# EAGLE schematic powermodule_OLDBUCK (EAGLE 9.6.2)
SCHEMATIC_VERSION: V5.0

## Sheet 1 of 9: SPI-Flash
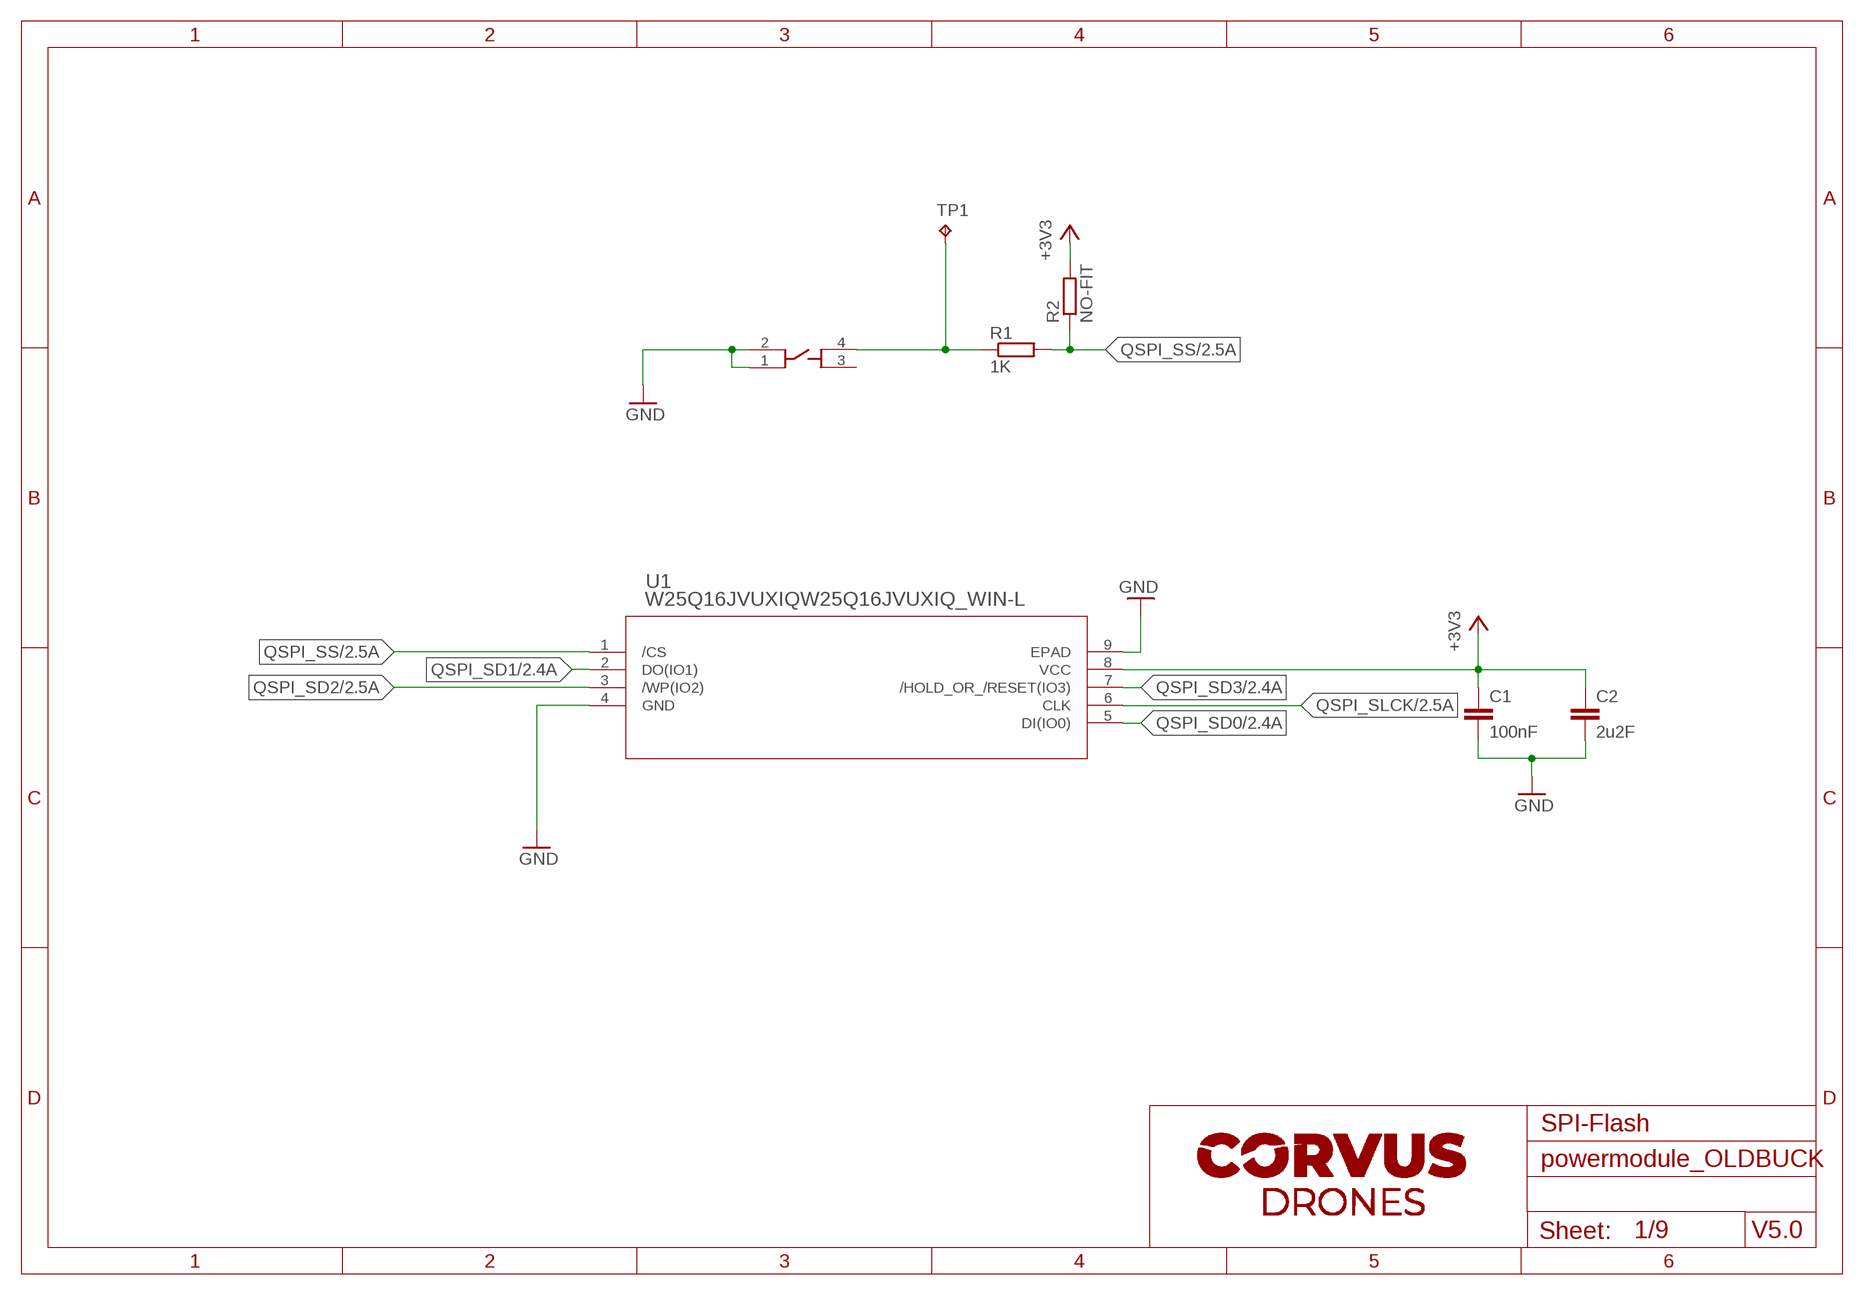
[diagram p0: schematic, sheet 1]

### Parts
C1  100nF  C-EUC0603  [C0603]
C2  2u2F  C-EUC0603  [C0603]
R1  1K  R-EU_R0603  [R0603]
R2  NO-FIT  R-EU_R0603  [R0603]
TP1  TPTP15R  [TP15R]
U1  W25Q16JVUXIQW25Q16JVUXIQ_WIN-L  [W25Q16JVUXIQ_WIN-L]
U$7  BOOTSEL  EVQ-P7J01P  [EVQ-P7J01P]

### Nets
+3V3: C1.1 C2.1 R2.2 U1.8(VCC) ; also sheet 2,4,6,7
GND: C1.2 C2.2 U1.4(GND) U1.9(EPAD) U$7.1 U$7.2 ; also sheet 2,3,4,5,6,7,8,9
N$1: R1.1 TP1.TP U$7.4
QSPI_SD0: U1.5(DI(IO0)) ; also sheet 2
QSPI_SD1: U1.2(DO(IO1)) ; also sheet 2
QSPI_SD2: U1.3(/WP(IO2)) ; also sheet 2
QSPI_SD3: U1.7(/HOLD_OR_/RESET(IO3)) ; also sheet 2
QSPI_SLCK: U1.6(CLK) ; also sheet 2
QSPI_SS: R1.2 R2.1 U1.1(/CS) ; also sheet 2
Unconnected: U$7.3

## Sheet 2 of 9: RP2040 mCU part
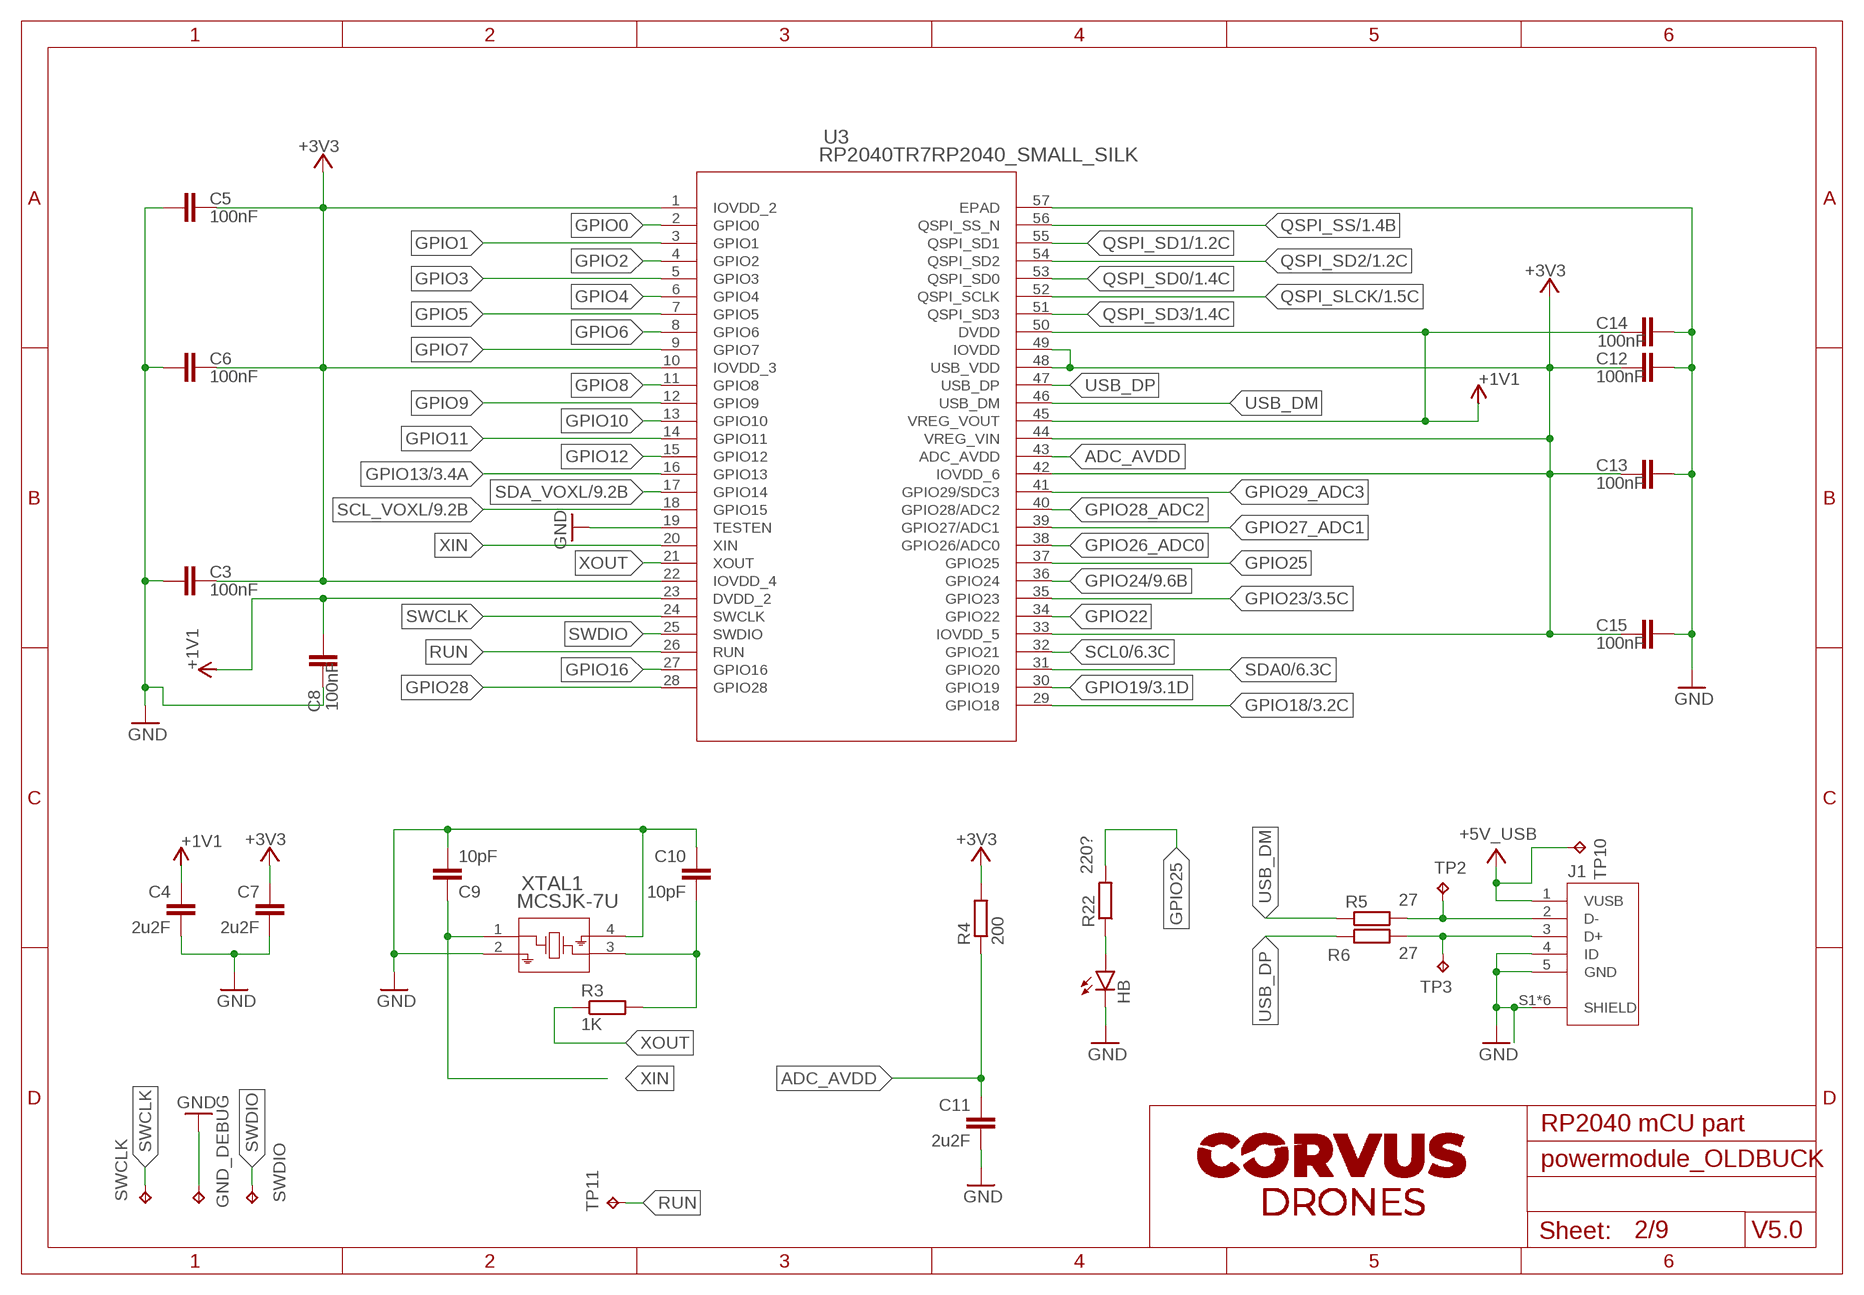
[diagram p1: schematic, sheet 2]

### Parts
C3  100nF  C-EUC0603  [C0603]
C4  2u2F  C-EUC0603  [C0603]
C5  100nF  C-EUC0603  [C0603]
C6  100nF  C-EUC0603  [C0603]
C7  2u2F  C-EUC0603  [C0603]
C8  100nF  C-EUC0603  [C0603]
C9  10pF  C-EUC0603  [C0603]
C10  10pF  C-EUC0603  [C0603]
C11  2u2F  C-EUC0603  [C0603]
C12  100nF  C-EUC0603  [C0603]
C13  100nF  C-EUC0603  [C0603]
C14  100nF  C-EUC0603  [C0603]
C15  100nF  C-EUC0603  [C0603]
GND_DEBUG  TPTP15R  [TP15R]
HB  LEDCHIPLED_0805  [CHIPLED_0805]
J1  10118193-0001LF  [FCI_10118193-0001LF]
R3  1K  R-EU_R0603  [R0603]
R4  200  R-EU_R0603  [R0603]
R5  27  R-EU_R0603  [R0603]
R6  27  R-EU_R0603  [R0603]
R22  220?  R-EU_R0603  [R0603]
SWCLK  TPTP15R  [TP15R]
SWDIO  TPTP15R  [TP15R]
TP2  TPTP15R  [TP15R]
TP3  TPTP15R  [TP15R]
TP10  TPTP15R  [TP15R]
TP11  TPTP15R  [TP15R]
U3  RP2040TR7RP2040_SMALL_SILK  [RP2040TR7_RPI-L_CUSTM]
XTAL1  MCSJK-7U  MCSJK-7U-12.00-10-10-80-B-10SMD3225_3.2X2.5X0.7_MTC-L  [SMD3225_3.2X2.5X0.7_MTC-L]

### Nets
+1V1: C4.2 C8.1 C14.2 U3.23(DVDD_2) U3.45(VREG_VOUT) U3.50(DVDD) ; supply symbol labelled 1V1
+3V3: C3.2 C5.1 C6.1 C7.2 C12.1 C13.1 C15.2 R4.2 U3.1(IOVDD_2) U3.10(IOVDD_3) U3.22(IOVDD_4) U3.33(IOVDD_5) U3.42(IOVDD_6) U3.44(VREG_VIN) U3.48(USB_VDD) U3.49(IOVDD) ; also sheet 1,4,6,7
+5V_USB: J1.1(VUSB) TP10.TP ; also sheet 3
ADC_AVDD: C11.2 R4.1 U3.43(ADC_AVDD)
GND: C3.1 C4.1 C5.2 C6.2 C7.1 C8.2 C9.1 C10.2 C11.1 C12.2 C13.2 C14.1 C15.1 GND_DEBUG.TP HB.C J1.4(ID) J1.5(GND) J1.S1(SHIELD) J1.S2(SHIELD) J1.S3(SHIELD) J1.S4(SHIELD) J1.S5(SHIELD) J1.S6(SHIELD) U3.19(TESTEN) U3.57(EPAD) XTAL1.2 XTAL1.4 ; also sheet 1,3,4,5,6,7,8,9
GPIO0: U3.2(GPIO0)
GPIO1: U3.3(GPIO1)
GPIO2: U3.4(GPIO2)
GPIO3: U3.5(GPIO3)
GPIO4: U3.6(GPIO4)
GPIO5: U3.7(GPIO5)
GPIO6: U3.8(GPIO6)
GPIO7: U3.9(GPIO7)
GPIO8: U3.11(GPIO8)
GPIO9: U3.12(GPIO9)
GPIO10: U3.13(GPIO10)
GPIO11: U3.14(GPIO11)
GPIO12: U3.15(GPIO12)
GPIO13: U3.16(GPIO13) ; also sheet 3
GPIO16: U3.27(GPIO16)
GPIO18: U3.29(GPIO18) ; also sheet 3
GPIO19: U3.30(GPIO19) ; also sheet 3
GPIO22: U3.34(GPIO22)
GPIO23: U3.35(GPIO23) ; also sheet 3
GPIO24: U3.36(GPIO24) ; also sheet 9
GPIO25: R22.2 U3.37(GPIO25)
GPIO26_ADC0: U3.38(GPIO26/ADC0)
GPIO27_ADC1: U3.39(GPIO27/ADC1)
GPIO28: U3.28(GPIO28)
GPIO28_ADC2: U3.40(GPIO28/ADC2)
GPIO29_ADC3: U3.41(GPIO29/SDC3)
N$10: C10.1 R3.2 XTAL1.3
N$24: HB.A R22.1
QSPI_SD0: U3.53(QSPI_SD0) ; also sheet 1
QSPI_SD1: U3.55(QSPI_SD1) ; also sheet 1
QSPI_SD2: U3.54(QSPI_SD2) ; also sheet 1
QSPI_SD3: U3.51(QSPI_SD3) ; also sheet 1
QSPI_SLCK: U3.52(QSPI_SCLK) ; also sheet 1
QSPI_SS: U3.56(QSPI_SS_N) ; also sheet 1
RUN: TP11.TP U3.26(RUN)
SCL0: U3.32(GPIO21) ; also sheet 6
SCL_VOXL: U3.18(GPIO15) ; also sheet 9
SDA0: U3.31(GPIO20) ; also sheet 6
SDA_VOXL: U3.17(GPIO14) ; also sheet 9
SWCLK: SWCLK.TP U3.24(SWCLK)
SWDIO: SWDIO.TP U3.25(SWDIO)
USB_DM: R5.1 U3.46(USB_DM)
USB_DP: R6.1 U3.47(USB_DP)
USBM_DM: J1.2(D-) R5.2 TP2.TP ; also sheet 6
USBM_DP: J1.3(D+) R6.2 TP3.TP ; also sheet 6
XIN: C9.2 U3.20(XIN) XTAL1.1
XOUT: R3.1 U3.21(XOUT)

## Sheet 3 of 9: Buck activators
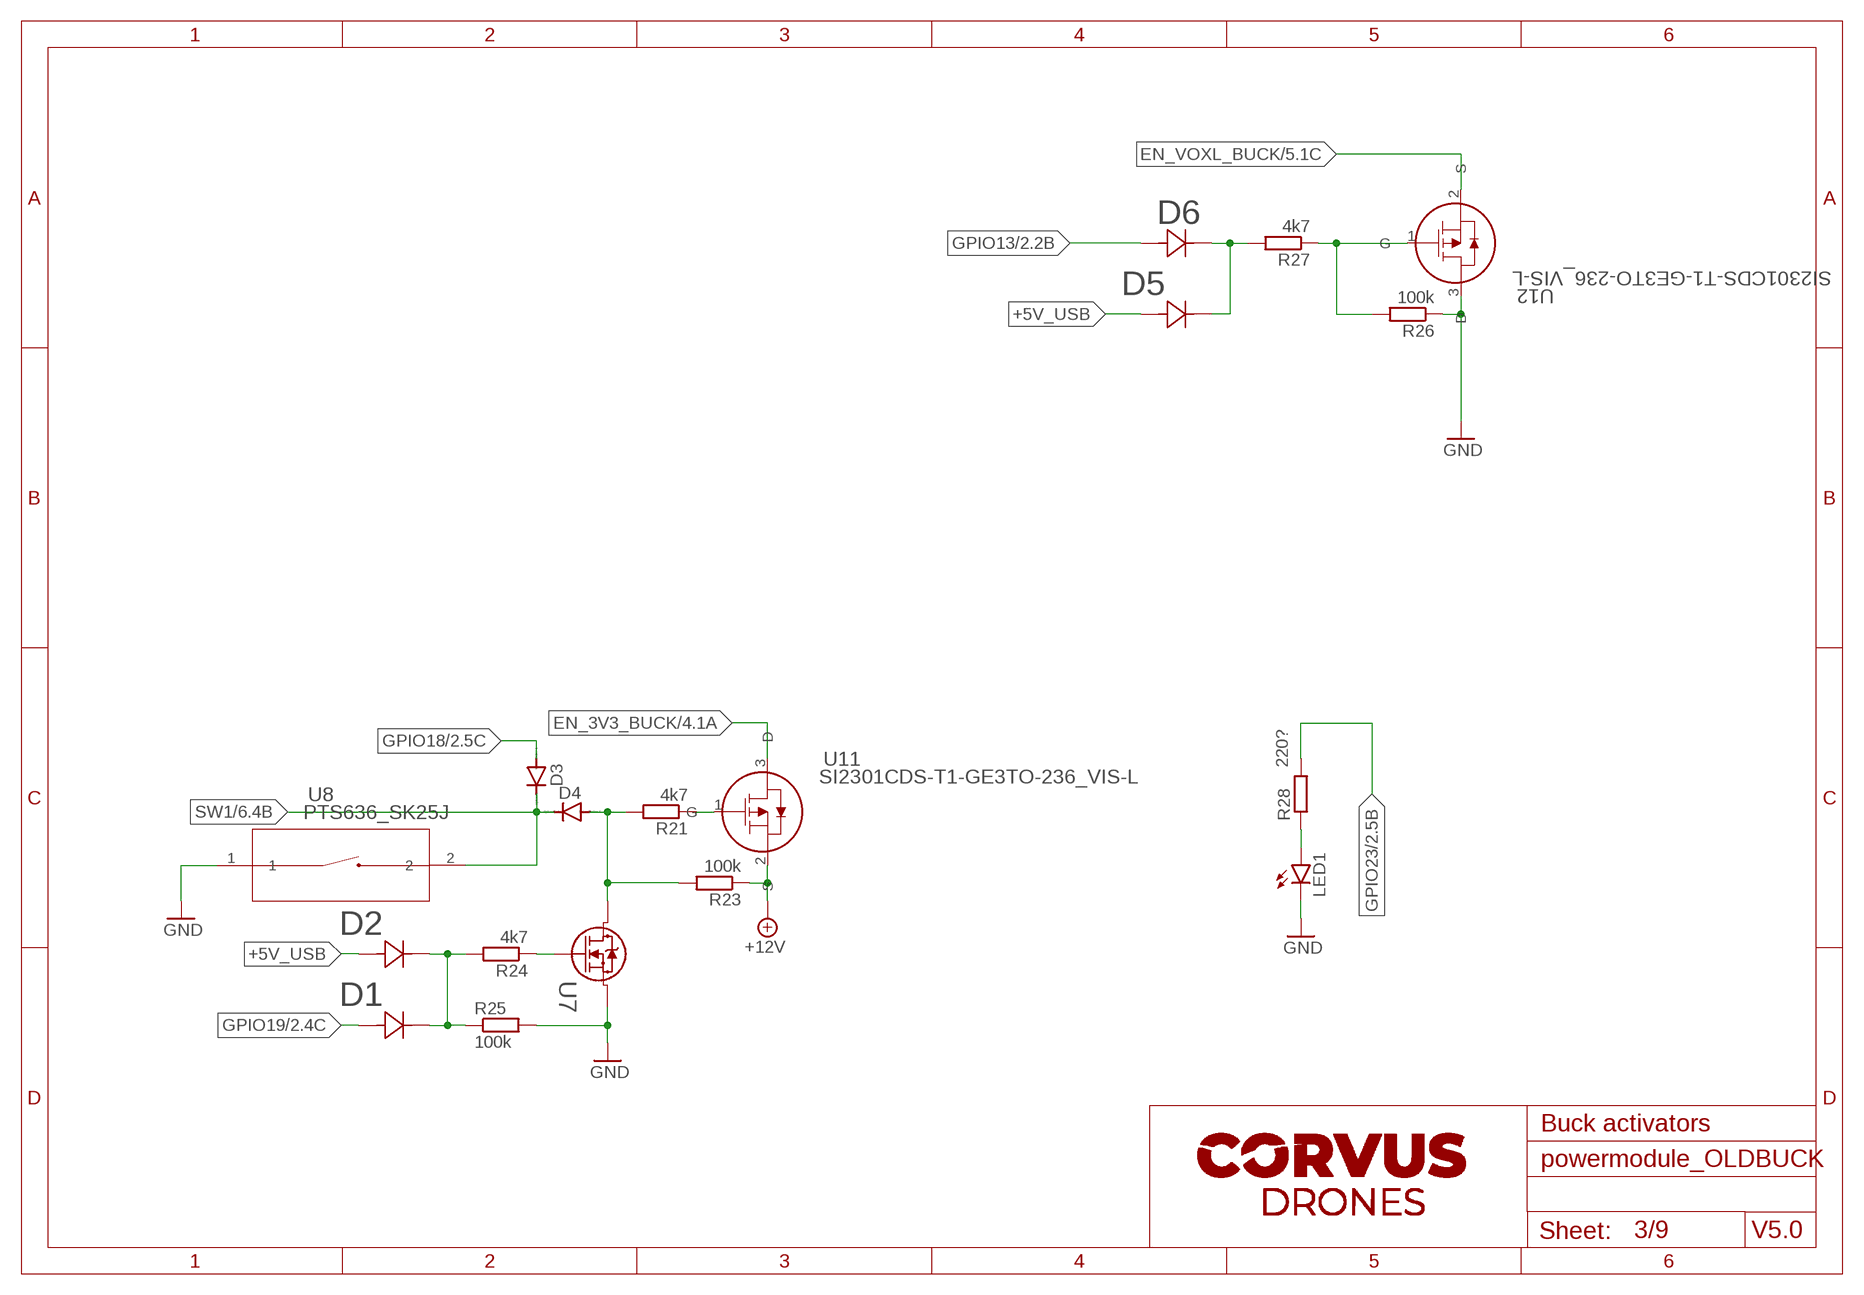
[diagram p2: schematic, sheet 3]

### Parts
D1  1N4148WS-7-FSOD323_DIO-L  [SOD323_DIO-L]
D2  1N4148WS-7-FSOD323_DIO-L  [SOD323_DIO-L]
D3  CGRM4002-G  [SOD-123_MINI-SMA]
D4  CGRM4002-G  [SOD-123_MINI-SMA]
D5  1N4148WS-7-FSOD323_DIO-L  [SOD323_DIO-L]
D6  1N4148WS-7-FSOD323_DIO-L  [SOD323_DIO-L]
LED1  LEDCHIPLED_0805  [CHIPLED_0805]
R21  4k7  R-EU_R0603  [R0603]
R23  100k  R-EU_R0603  [R0603]
R24  4k7  R-EU_R0603  [R0603]
R25  100k  R-EU_R0603  [R0603]
R26  100k  R-EU_R0603  [R0603]
R27  4k7  R-EU_R0603  [R0603]
R28  220?  R-EU_R0603  [R0603]
U7  2N7002,215TO-236AB_NEX-L  [TO-236AB_NEX-L]
U8  PTS636_SK25J  PTS636_SK25J_SMTR_LFSSW_PTS636_SK25J_SMTR_LFS_CNK-M  [SW_PTS636_SK25J_SMTR_LFS_CNK-M]
U11  SI2301CDS-T1-GE3TO-236_VIS-L  [TO-236_VIS-L]
U12  SI2301CDS-T1-GE3TO-236_VIS-L  [TO-236_VIS-L]

### Nets
+5V_USB: D2.2 D5.2 ; also sheet 2
+12V: R23.1 U11.2(S) ; also sheet 4,5,6
EN_3V3_BUCK: U11.3(D) ; also sheet 4
EN_VOXL_BUCK: U12.2(S) ; also sheet 5
GND: LED1.C R25.2 R26.1 U7.2 U8.1 U12.3(D) ; also sheet 1,2,4,5,6,7,8,9
GPIO13: D6.2 ; also sheet 2
GPIO18: D3.A ; also sheet 2
GPIO19: D1.2 ; also sheet 2
GPIO23: R28.2 ; also sheet 2
N$15: R21.1 U11.1(G)
N$21: D5.1 D6.1 R27.2
N$25: D4.A R21.2 R23.2 U7.3
N$26: R26.2 R27.1 U12.1(G)
N$27: R24.1 U7.1
N$28: LED1.A R28.1
N$30: D1.1 D2.1 R24.2 R25.1
SW1: D3.C D4.C U8.2 ; also sheet 6

## Sheet 4 of 9: 3V3 & 5V buck
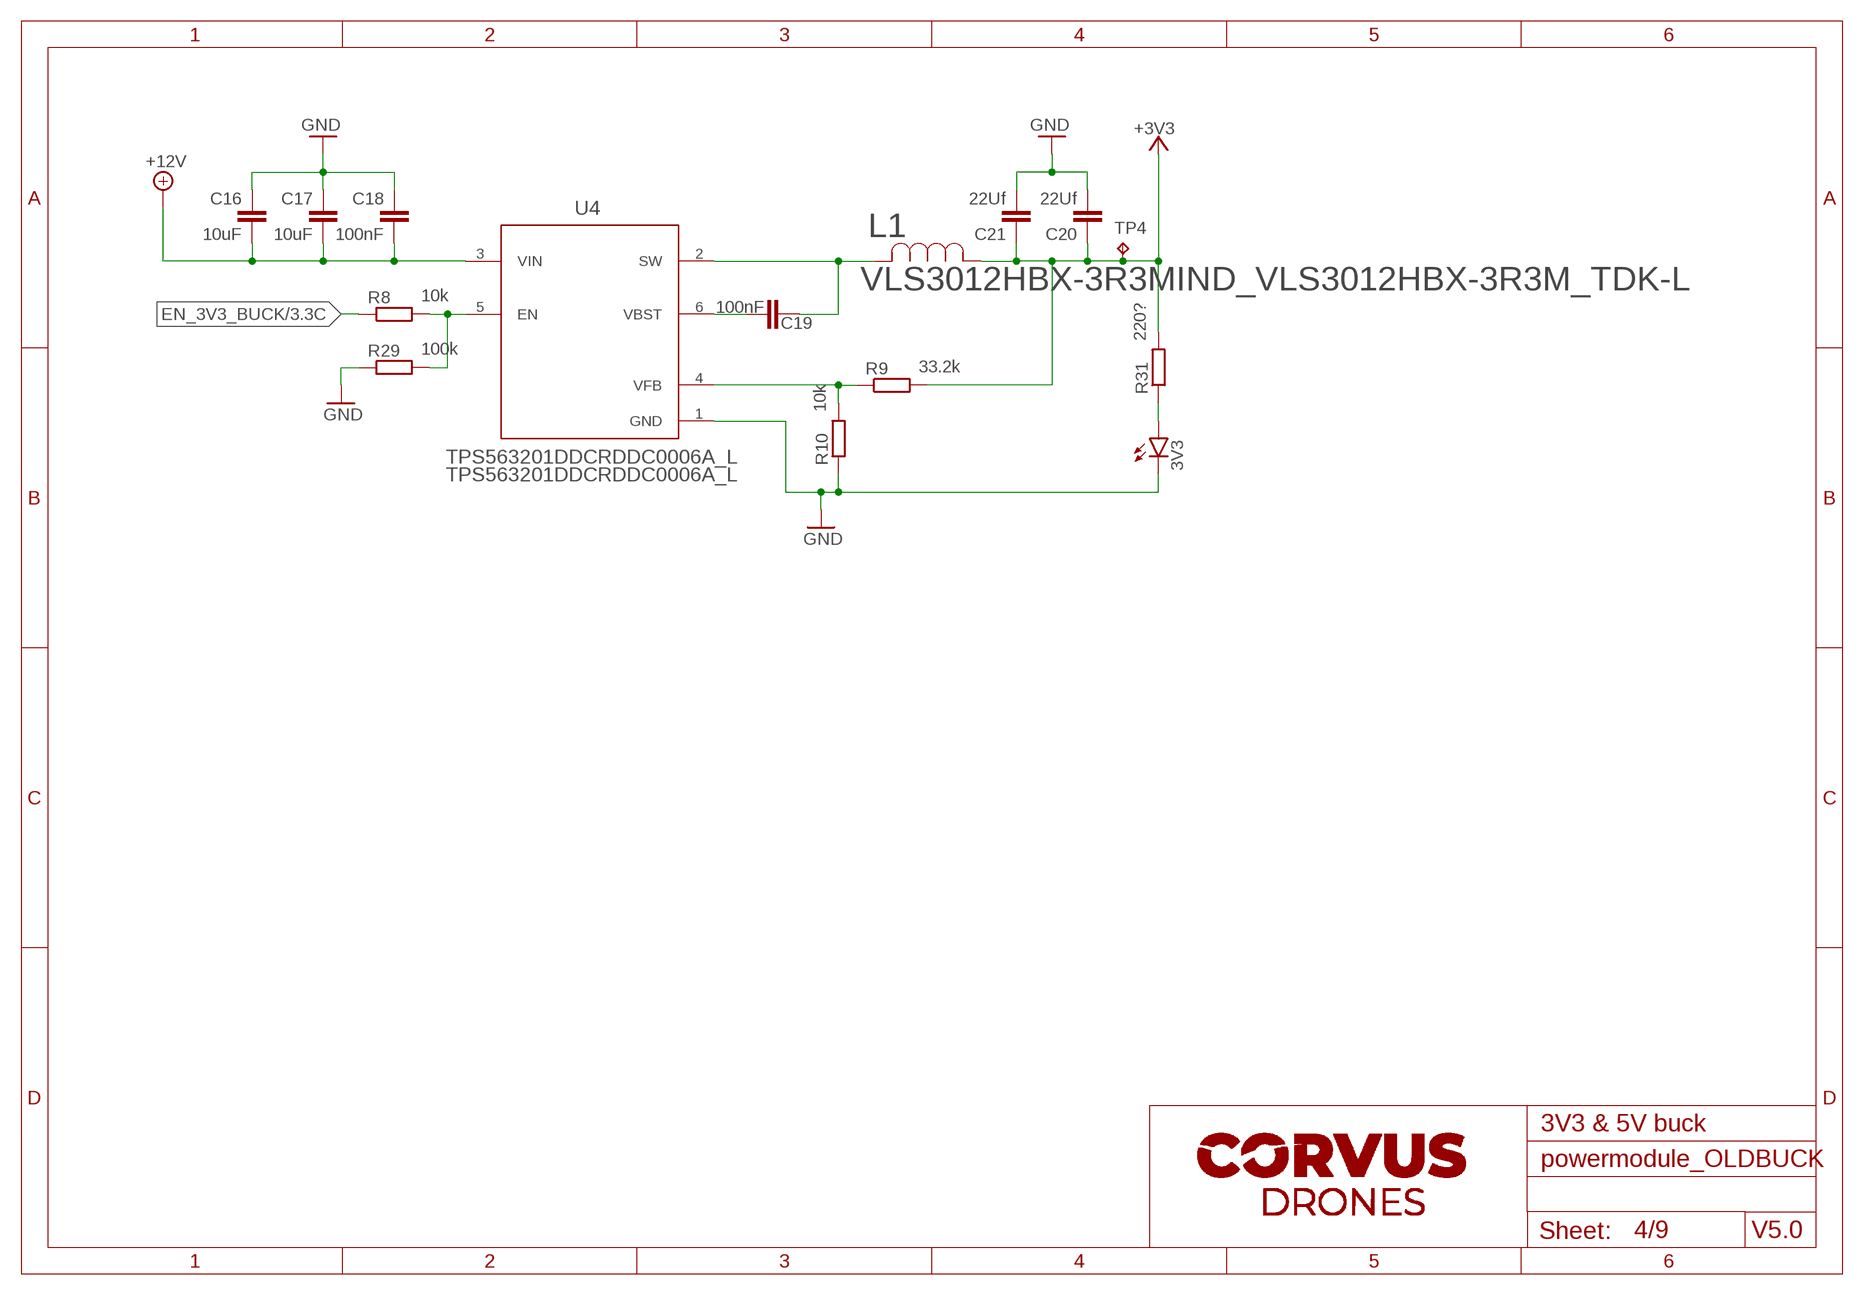
[diagram p3: schematic, sheet 4]

### Parts
3V3  LEDCHIPLED_0805  [CHIPLED_0805]
C16  10uF  C-EUC0603  [C0603]
C17  10uF  C-EUC0603  [C0603]
C18  100nF  C-EUC0603  [C0603]
C19  100nF  C-EUC0603  [C0603]
C20  22Uf  C-EUC1206  [C1206]
C21  22Uf  C-EUC1206  [C1206]
L1  VLS3012HBX-3R3MIND_VLS3012HBX-3R3M_TDK-L  [IND_VLS3012HBX-3R3M_TDK-L]
R8  10k  R-EU_R0603  [R0603]
R9  33.2k  R-EU_R0603  [R0603]
R10  10k  R-EU_R0603  [R0603]
R29  100k  R-EU_R0603  [R0603]
R31  220?  R-EU_R0603  [R0603]
TP4  TPTP15R  [TP15R]
U4  TPS563201DDCRDDC0006A_L  [DDC0006A_L]

### Nets
+3V3: C20.1 C21.1 L1.1 R9.2 R31.2 TP4.TP ; also sheet 1,2,6,7
+12V: C16.1 C17.1 C18.1 U4.3(VIN) ; also sheet 3,5,6
EN_3V3_BUCK: R8.1 ; also sheet 3
GND: 3V3.C C16.2 C17.2 C18.2 C20.2 C21.2 R10.1 R29.1 U4.1(GND) ; also sheet 1,2,3,5,6,7,8,9
N$4: R8.2 R29.2 U4.5(EN)
N$5: R9.1 R10.2 U4.4(VFB)
N$6: C19.1 U4.6(VBST)
N$8: C19.2 L1.2 U4.2(SW)
N$32: 3V3.A R31.1

## Sheet 5 of 9: Buckconveter voxl
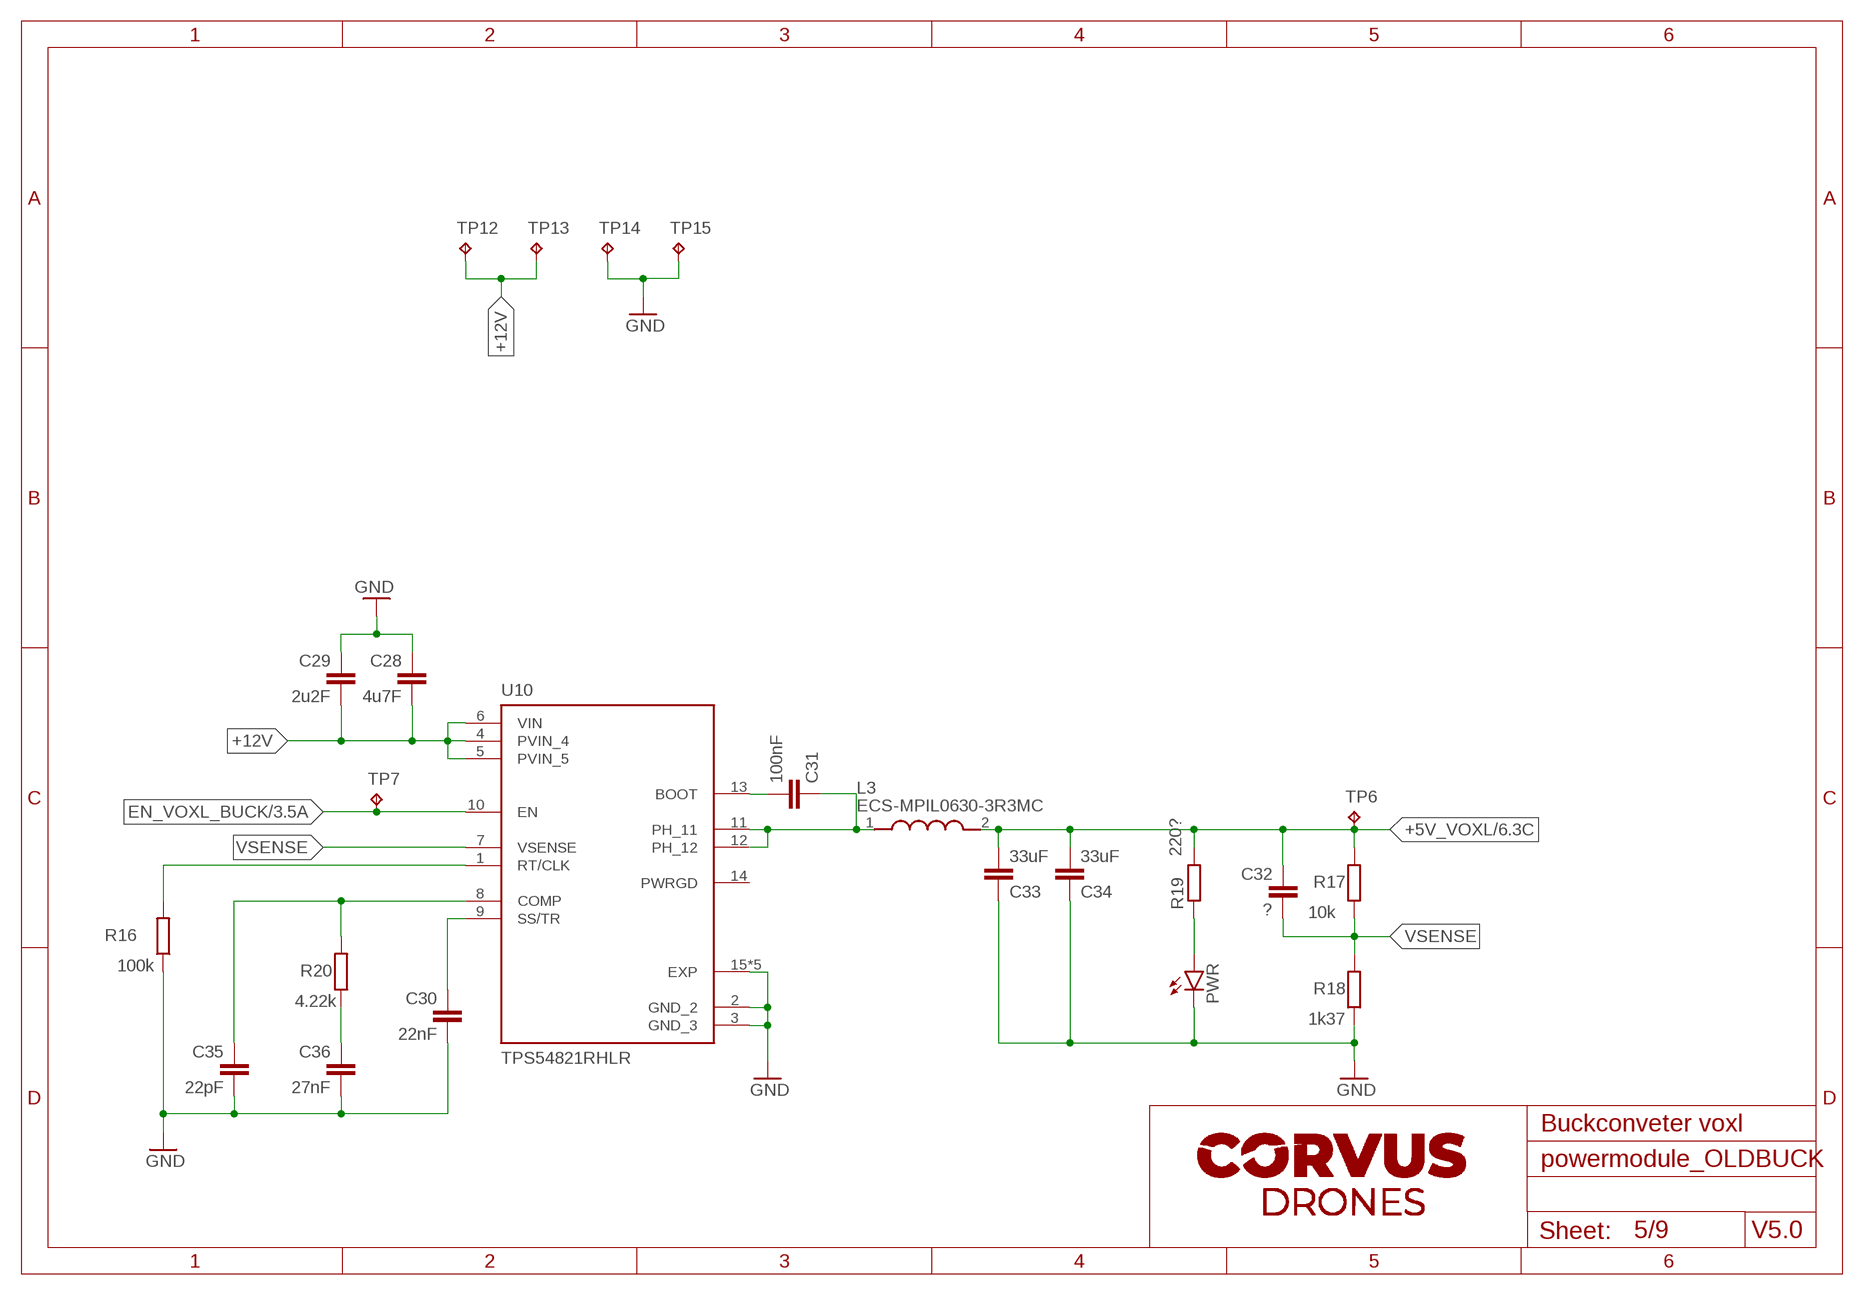
[diagram p4: schematic, sheet 5]

### Parts
C28  4u7F  C_08054U7  [C0805]
C29  2u2F  C_08052U2  [C0805]
C30  22nF  C-EUC0603  [C0603]
C31  100nF  C-EUC0603  [C0603]
C32  ?  C-EUC0603  [C0603]
C33  33uF  C-EUC1206  [C1206]
C34  33uF  C-EUC1206  [C1206]
C35  22pF  C-EUC0603  [C0603]
C36  27nF  C-EUC0603  [C0603]
L3  ECS-MPIL0630-3R3MC  [IND_ECS-MPIL0630-3R3MC]
PWR  LEDCHIPLED_0805  [CHIPLED_0805]
R16  100k  R-EU_R0603  [R0603]
R17  10k  R-EU_R0603  [R0603]
R18  1k37  R-EU_R0603  [R0603]
R19  220?  R-EU_R0603  [R0603]
R20  4.22k  R-EU_R0603  [R0603]
TP6  TPTP15R  [TP15R]
TP7  TPTP15R  [TP15R]
TP12  TPTP15R  [TP15R]
TP13  TPTP15R  [TP15R]
TP14  TPTP15R  [TP15R]
TP15  TPTP15R  [TP15R]
U10  TPS54821RHLR  [IC_TPS54821RHLR]

### Nets
+5V_VOXL: C32.2 C33.1 C34.1 L3.2 R17.2 R19.2 TP6.TP ; also sheet 6,7,8
+12V: C28.1 C29.1 TP12.TP TP13.TP U10.4(PVIN_4) U10.5(PVIN_5) U10.6(VIN) ; also sheet 3,4,6
EN_VOXL_BUCK: TP7.TP U10.10(EN) ; also sheet 3
GND: C28.2 C29.2 C30.1 C33.2 C34.2 C35.1 C36.1 PWR.C R16.1 R18.1 TP14.TP TP15.TP U10.2(GND_2) U10.3(GND_3) U10.15(EXP) U10.16(EXP) U10.17(EXP) U10.18(EXP) U10.19(EXP) ; also sheet 1,2,3,4,6,7,8,9
N$16: R16.2 U10.1(RT/CLK)
N$17: C31.2 L3.1 U10.11(PH_11) U10.12(PH_12)
N$18: C30.2 U10.9(SS/TR)
N$19: C31.1 U10.13(BOOT)
N$20: PWR.A R19.1
N$22: C35.2 R20.2 U10.8(COMP)
N$23: C36.2 R20.1
VSENSE: C32.1 R17.1 R18.2 U10.7(VSENSE)
Unconnected: U10.14(PWRGD)

## Sheet 6 of 9: connections
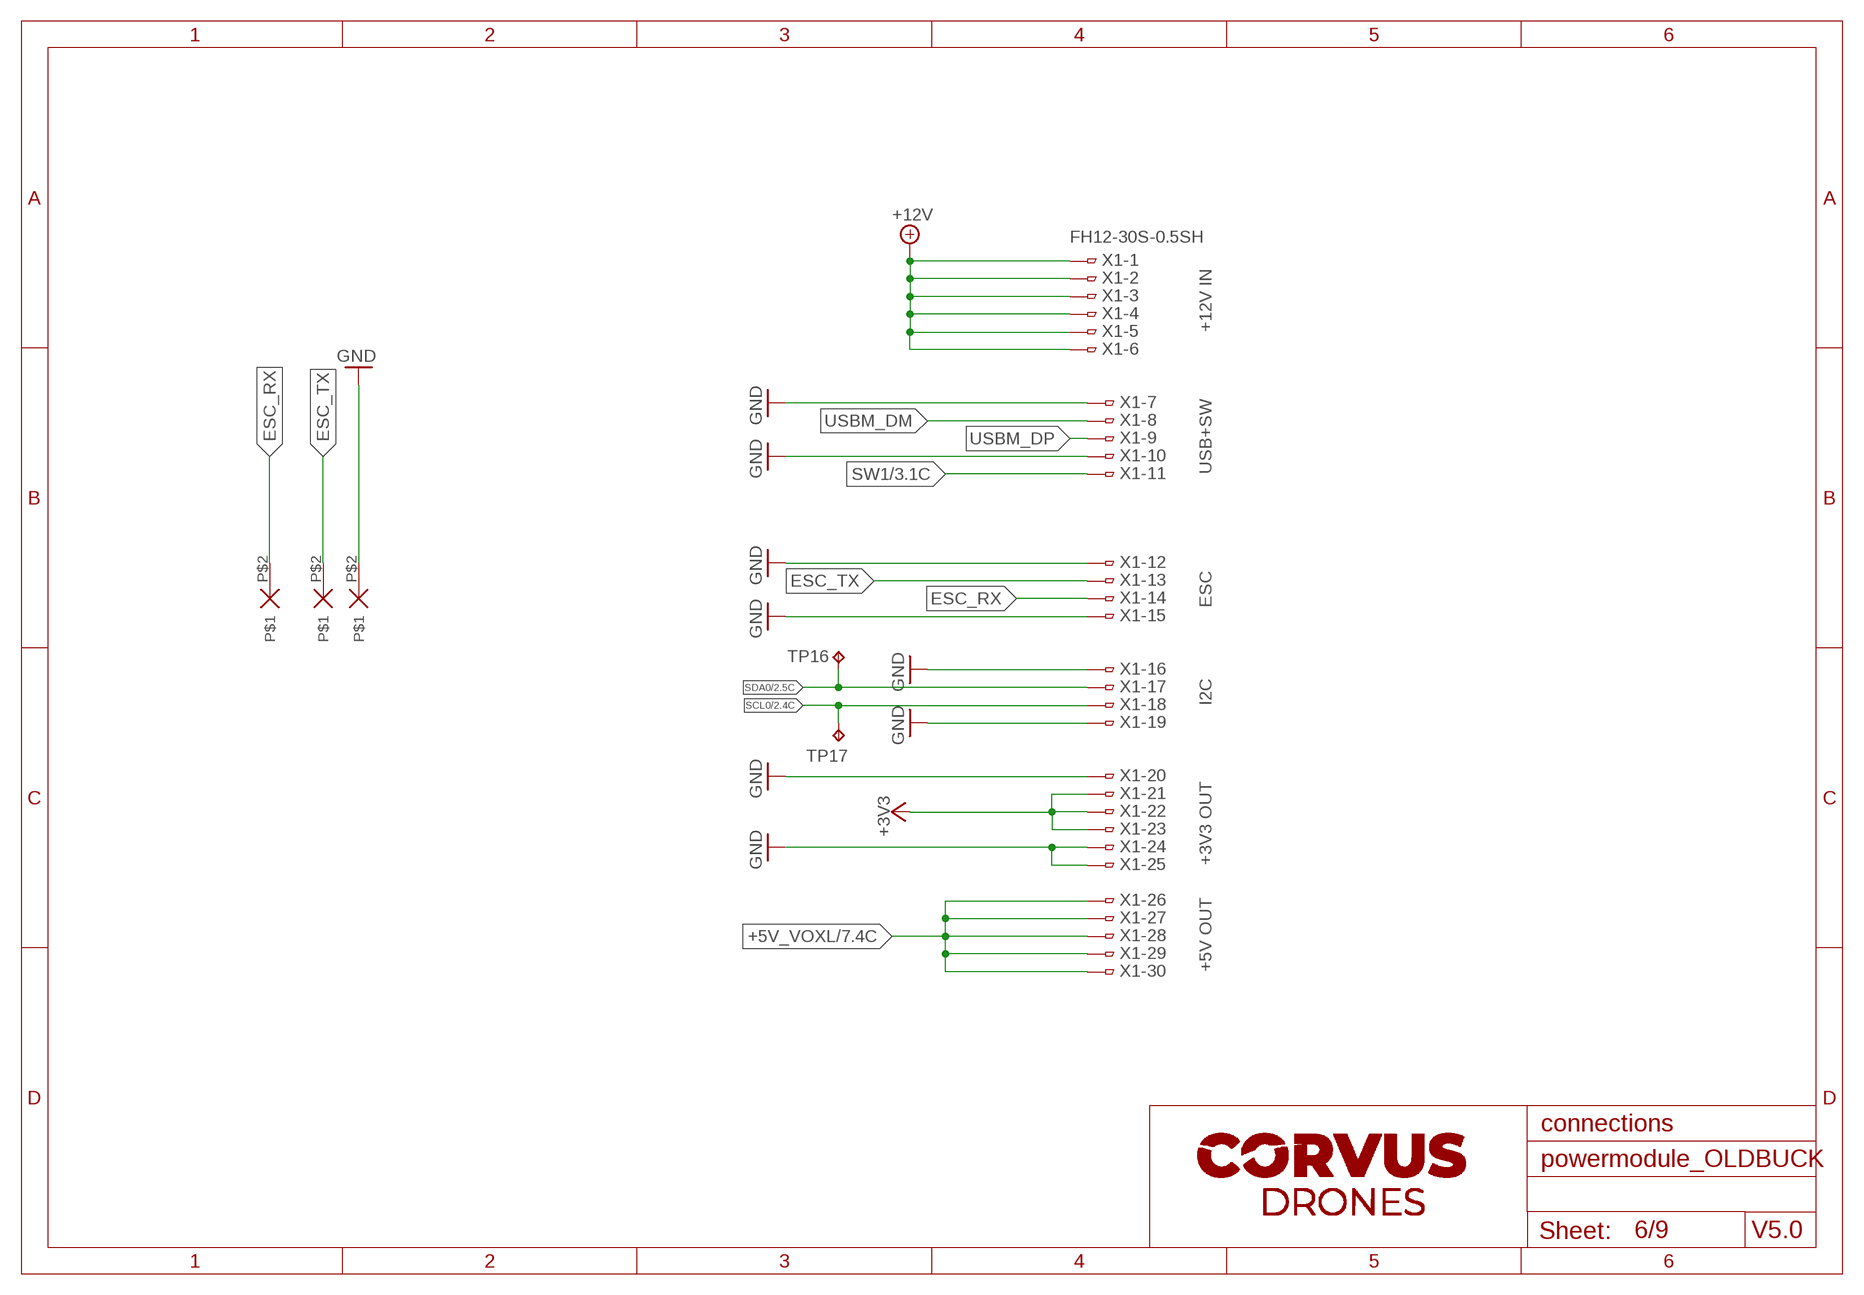
[diagram p5: schematic, sheet 6]

### Parts
EGND  TH-0.75/0.6  [TH-0.75/0.6]
RX  TH-0.75/0.6  [TH-0.75/0.6]
TP16  TPTP15R  [TP15R]
TP17  TPTP15R  [TP15R]
TX  TH-0.75/0.6  [TH-0.75/0.6]
X1  FH12-30S-0.5SH  [FH12-30S-0.5SH]

### Nets
+3V3: X1.21 X1.22 X1.23 ; also sheet 1,2,4,7
+5V_VOXL: X1.26 X1.27 X1.28 X1.29 X1.30 ; also sheet 5,7,8
+12V: X1.1 X1.2 X1.3 X1.4 X1.5 X1.6 ; also sheet 3,4,5
ESC_RX: RX.P$2 X1.14
ESC_TX: TX.P$2 X1.13
GND: EGND.P$2 X1.7 X1.10 X1.12 X1.15 X1.16 X1.19 X1.20 X1.24 X1.25 ; also sheet 1,2,3,4,5,7,8,9
SCL0: TP17.TP X1.18 ; also sheet 2
SDA0: TP16.TP X1.17 ; also sheet 2
SW1: X1.11 ; also sheet 3
USBM_DM: X1.8 ; also sheet 2
USBM_DP: X1.9 ; also sheet 2

### Notes on the sheet
- +12V IN
- USB+SW
- ESC
- I2C
- +3V3 OUT
- +5V OUT

## Sheet 7 of 9: WiFi
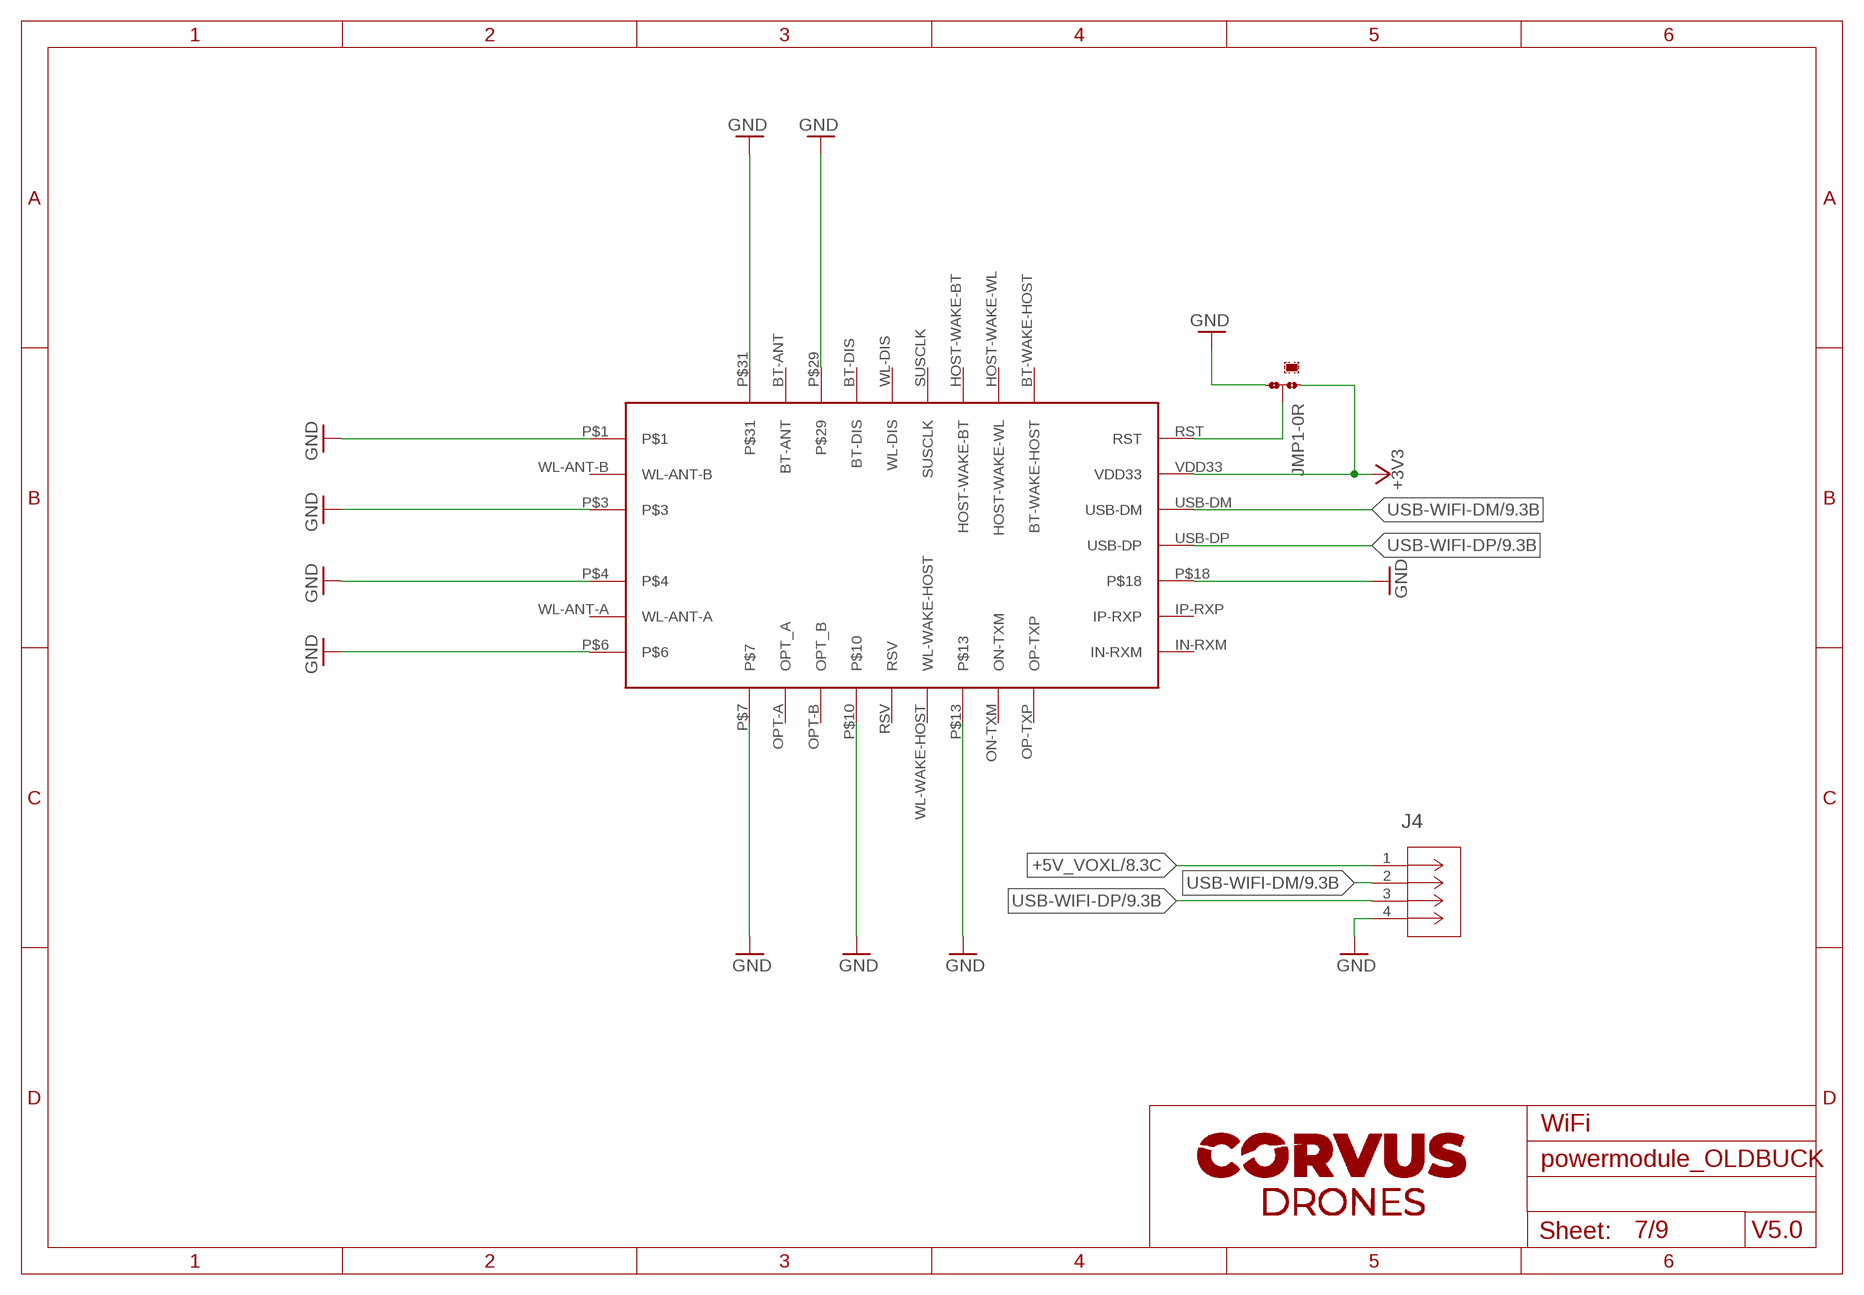
[diagram p6: schematic, sheet 7]

### Parts
J4  USB1125-GF-B  [CONN_USB1125-GF-B_GCT]
JMP1  0R-JUMPA  [A0R-JMP]
U$5  WIFI-RTL8822BU  [WIFI-RTL8822BU]

### Nets
+3V3: JMP1.1 U$5.VDD33 ; also sheet 1,2,4,6
+5V_VOXL: J4.1 ; also sheet 5,6,8
GND: J4.4 JMP1.3 U$5.P$1 U$5.P$3 U$5.P$4 U$5.P$6 U$5.P$7 U$5.P$10 U$5.P$13 U$5.P$18 U$5.P$29 U$5.P$31 ; also sheet 1,2,3,4,5,6,8,9
N$13: JMP1.2 U$5.RST
USB-WIFI-DM: J4.2 U$5.USB-DM ; also sheet 9
USB-WIFI-DP: J4.3 U$5.USB-DP ; also sheet 9
Unconnected: U$5.BT-ANT U$5.BT-DIS U$5.BT-WAKE-HOST U$5.HOST-WAKE-BT U$5.HOST-WAKE-WL U$5.IN-RXM U$5.IP-RXP U$5.ON-TXM U$5.OP-TXP U$5.OPT-A(OPT_A) U$5.OPT-B(OPT_B) U$5.RSV U$5.SUSCLK U$5.WL-ANT-A U$5.WL-ANT-B U$5.WL-DIS U$5.WL-WAKE-HOST

## Sheet 8 of 9: Voxl2 connection [J5]
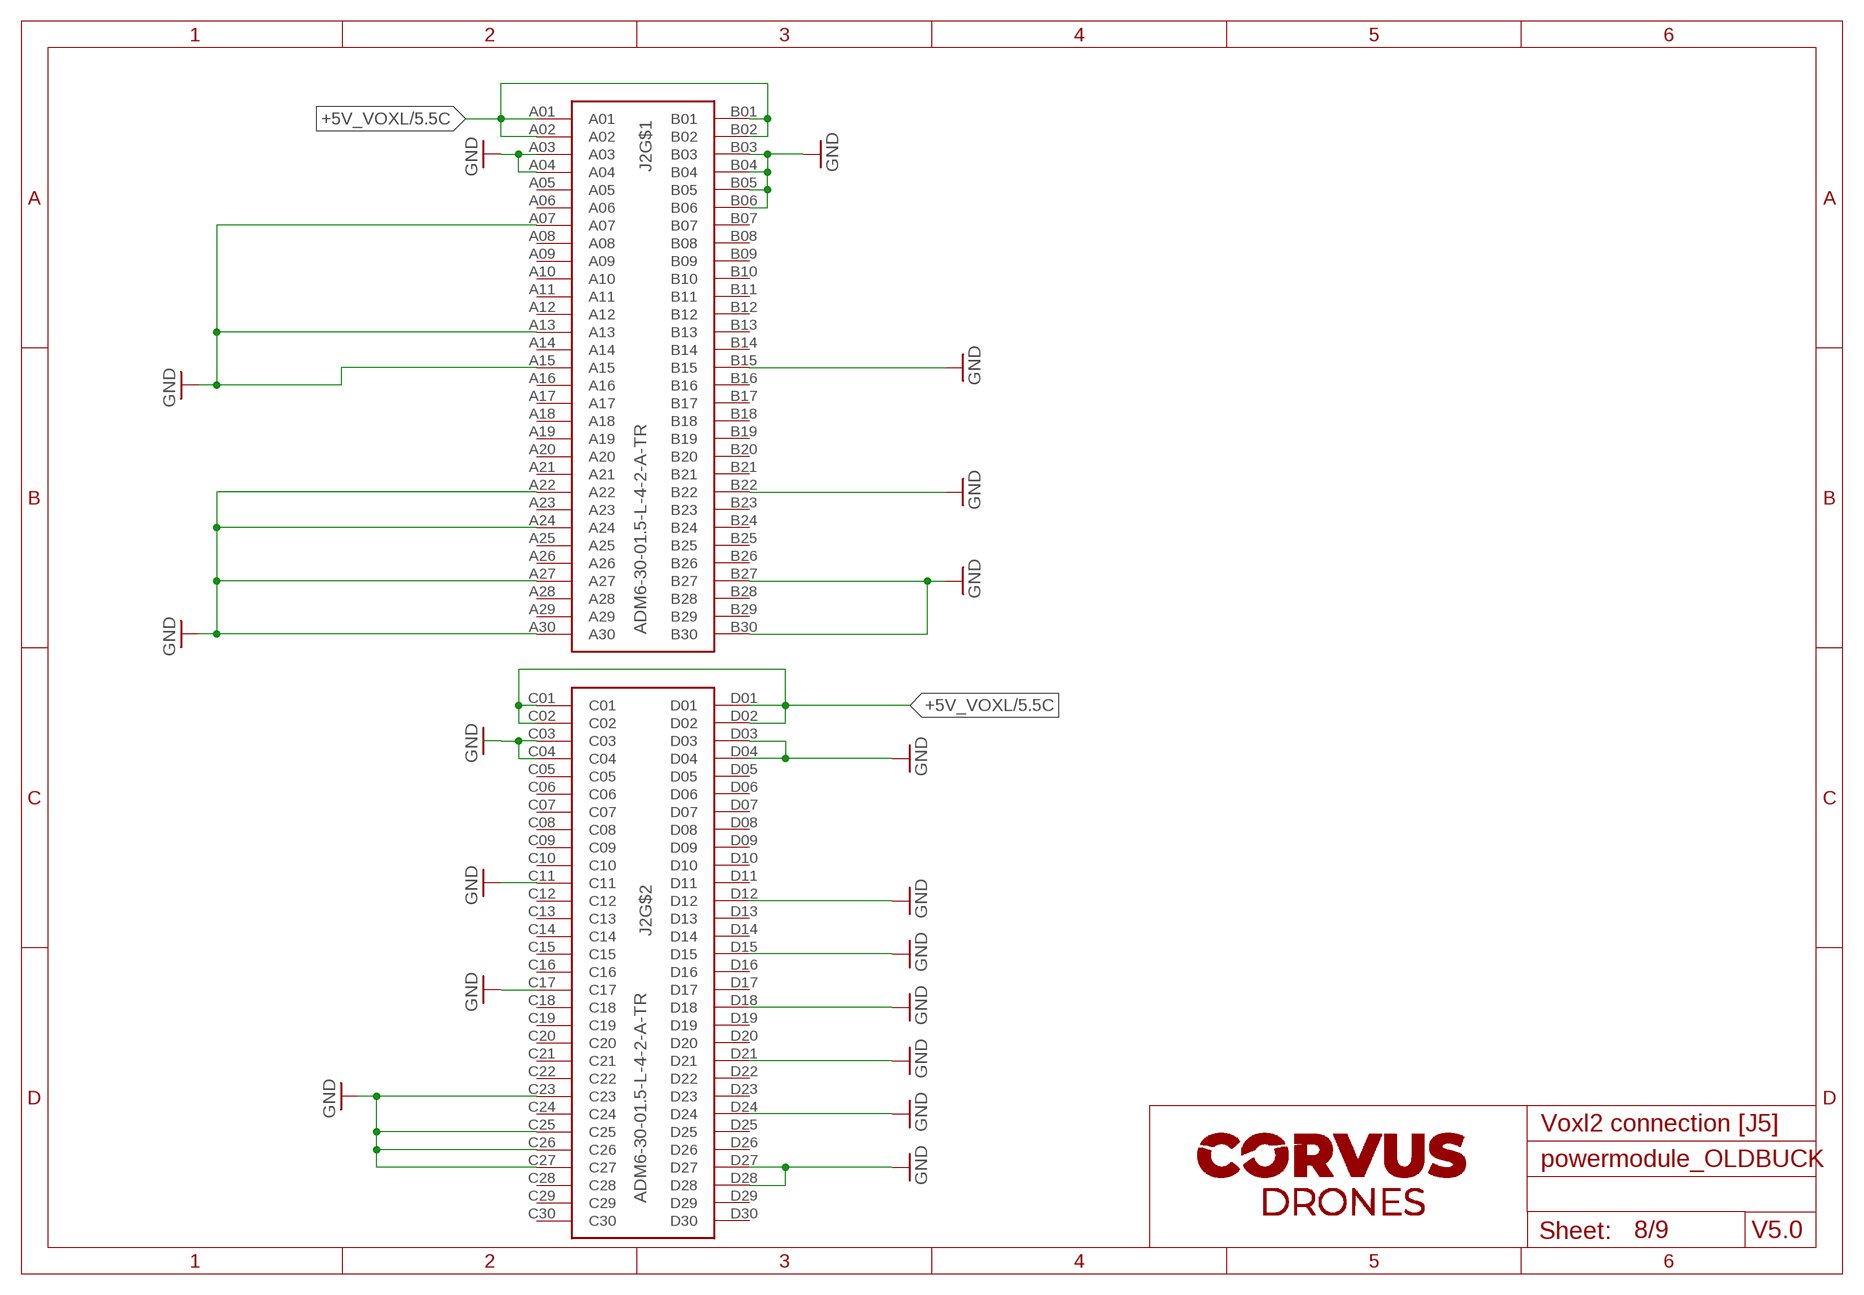
[diagram p7: schematic, sheet 8]

### Parts
J2  ADM6-30-01.5-L-4-2-A-TR  [SAMTEC_ADM6-30-01.5-L-4-2-A-TR]

### Nets
+5V_VOXL: J2.A01 J2.A02 J2.B01 J2.B02 J2.C01 J2.C02 J2.D01 J2.D02 ; also sheet 5,6,7
GND: J2.A03 J2.A04 J2.A07 J2.A13 J2.A15 J2.A22 J2.A24 J2.A27 J2.A30 J2.B03 J2.B04 J2.B05 J2.B06 J2.B15 J2.B22 J2.B27 J2.B30 J2.C03 J2.C04 J2.C11 J2.C17 J2.C23 J2.C25 J2.C26 J2.C27 J2.D03 J2.D04 J2.D12 J2.D15 J2.D18 J2.D21 J2.D24 J2.D27 J2.D28 ; also sheet 1,2,3,4,5,6,7,9
Unconnected: J2.A05 J2.A06 J2.A08 J2.A09 J2.A10 J2.A11 J2.A12 J2.A14 J2.A16 J2.A17 J2.A18 J2.A19 J2.A20 J2.A21 J2.A23 J2.A25 J2.A26 J2.A28 J2.A29 J2.B07 J2.B08 J2.B09 J2.B10 J2.B11 J2.B12 J2.B13 J2.B14 J2.B16 J2.B17 J2.B18 J2.B19 J2.B20 J2.B21 J2.B23 J2.B24 J2.B25 J2.B26 J2.B28 J2.B29 J2.C05 J2.C06 J2.C07 J2.C08 J2.C09 J2.C10 J2.C12 J2.C13 J2.C14 J2.C15 J2.C16 J2.C18 J2.C19 J2.C20 J2.C21 J2.C22 J2.C24 J2.C28 J2.C29 J2.C30 J2.D05 J2.D06 J2.D07 J2.D08 J2.D09 J2.D10 J2.D11 J2.D13 J2.D14 J2.D16 J2.D17 J2.D19 J2.D20 J2.D22 J2.D23 J2.D25 J2.D26 J2.D29 J2.D30

## Sheet 9 of 9: VOXL2 Connection [J3]
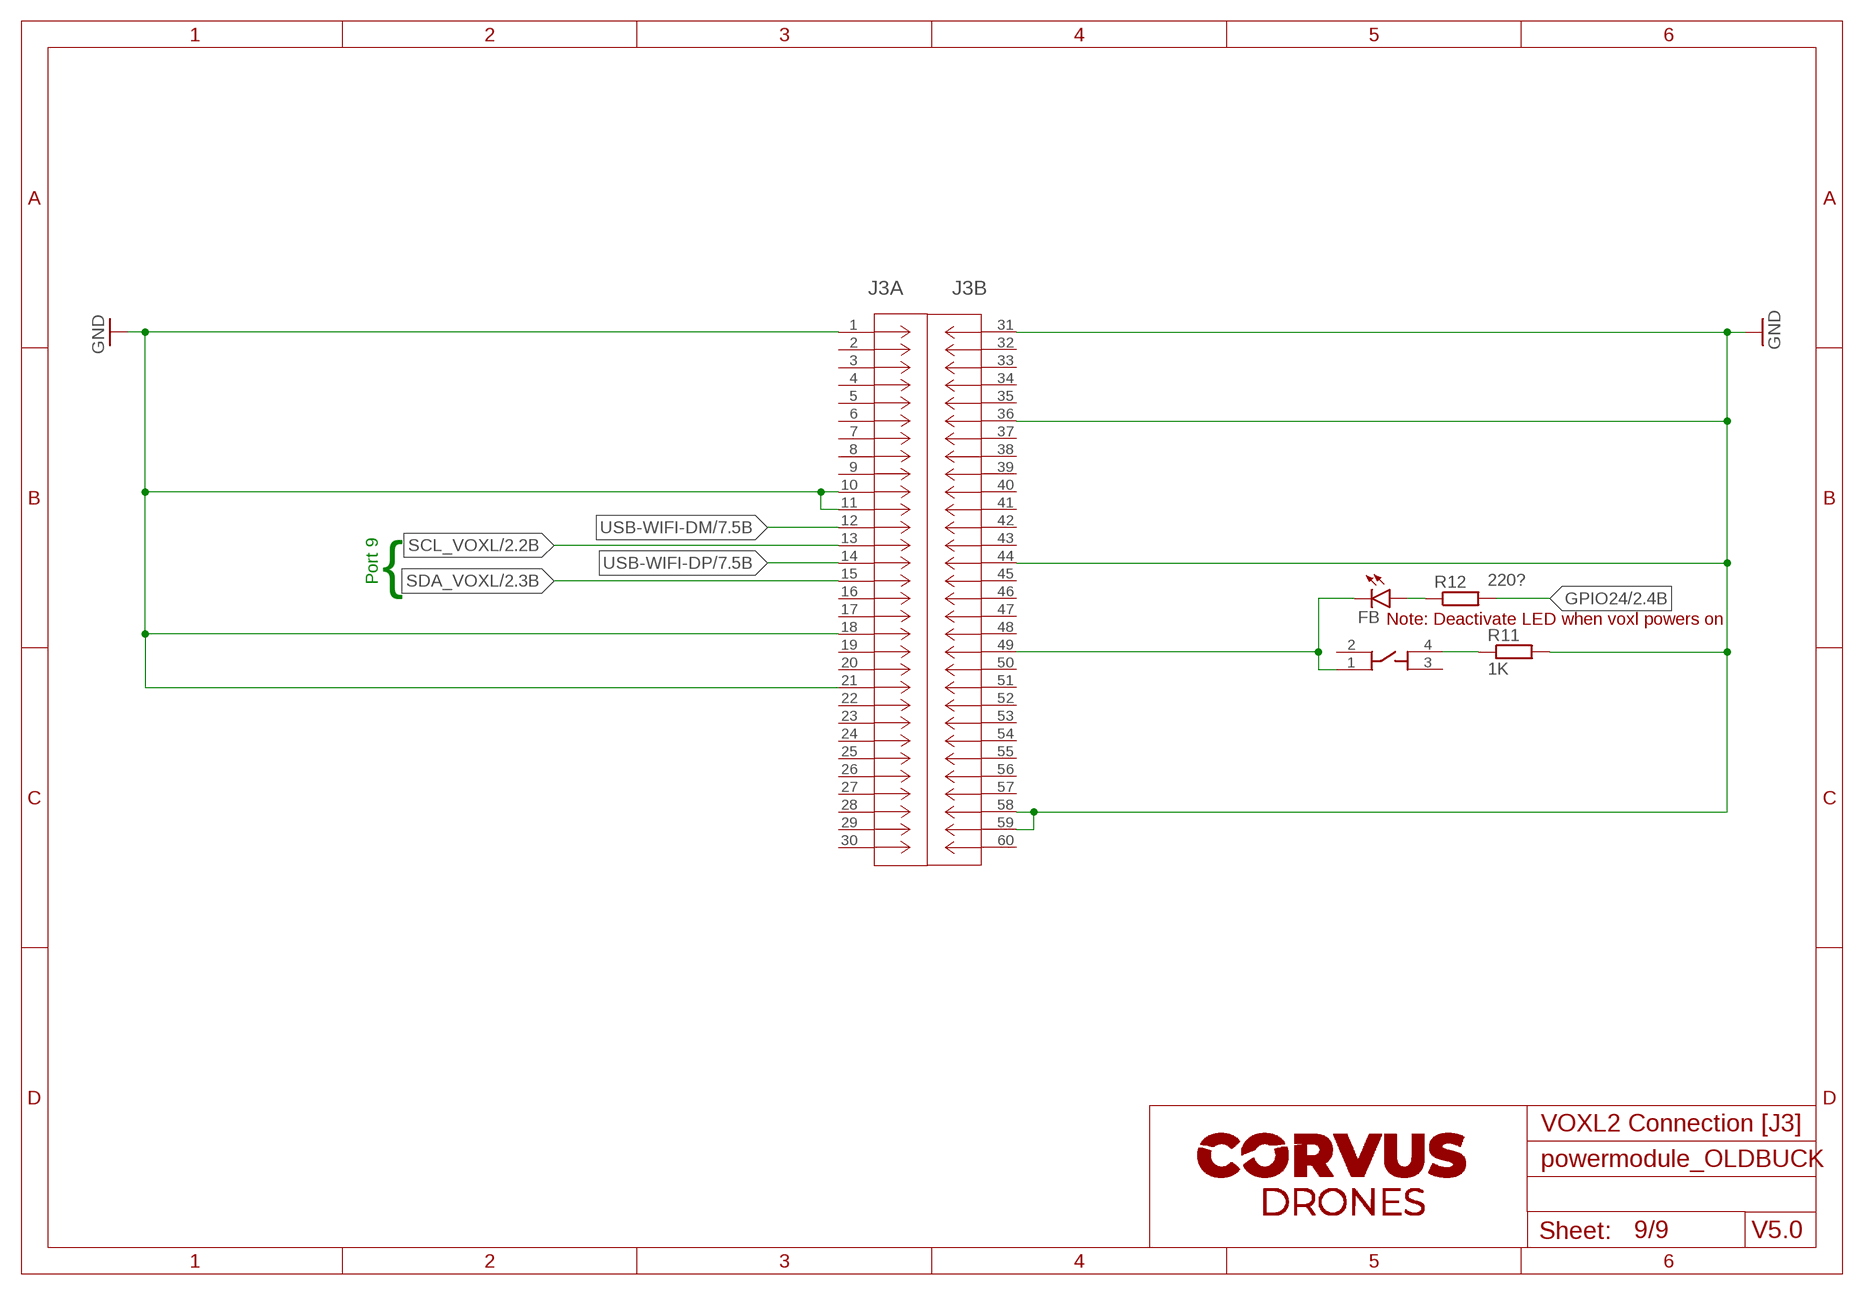
[diagram p8: schematic, sheet 9]

### Parts
FB  LEDCHIPLED_0805  [CHIPLED_0805]
J3  QTH-030-01-L-D-ACONN_QTH-030-02-L-D-A-K-FR_S00  [CONN_QTH-030-02-L-D-A-K-FR_S00]
R11  1K  R_0603_1K  [R0603]
R12  220?  R-EU_R0603  [R0603]
U$6  FASTBOOT  EVQ-P7J01P  [EVQ-P7J01P]

### Nets
GND: J3.1 J3.10 J3.11 J3.18 J3.21 J3.31 J3.36 J3.44 J3.58 J3.59 R11.2 ; also sheet 1,2,3,4,5,6,7,8
GPIO24: R12.2 ; also sheet 2
N$7: R11.1 U$6.4
N$9: FB.C J3.49 U$6.1
N$12: FB.A R12.1
SCL_VOXL: J3.13 ; also sheet 2
SDA_VOXL: J3.15 ; also sheet 2
USB-WIFI-DM: J3.12 ; also sheet 7
USB-WIFI-DP: J3.14 ; also sheet 7
Unconnected: J3.2 J3.3 J3.4 J3.5 J3.6 J3.7 J3.8 J3.9 J3.16 J3.17 J3.19 J3.20 J3.22 J3.23 J3.24 J3.25 J3.26 J3.27 J3.28 J3.29 J3.30 J3.32 J3.33 J3.34 J3.35 J3.37 J3.38 J3.39 J3.40 J3.41 J3.42 J3.43 J3.45 J3.46 J3.47 J3.48 J3.50 J3.51 J3.52 J3.53 J3.54 J3.55 J3.56 J3.57 J3.60 U$6.2 U$6.3

### Notes on the sheet
- Port 9 | {
- Note: Deactivate LED when voxl powers on

## Library data of the parts
3V3 FB HB LED1 PWR = led_CUSTOM:LED: LED OSRAM: - CHIPLED LG R971, LG N971, LY N971, LG Q971, LY Q971, LO R971, LY R971 LH N974, LH R974 LS Q976, LO Q976, LY Q976 LO Q996 - Hyper CHIPLED LW Q18S LB Q993, LB Q99A, LB R99A - SideLED LS A670, LO A670, LY A670, LG A670, LP A670 LB A673, LV A673, LT A673, LW A673 LH A674 LY A675 LS A676, LA A676, LO A676, LY A676, LW A676 LS A679, LY A679, LG A679 - Hyper Micro SIDELED® LS Y876, LA Y876, LO Y876, LY Y876 LT Y87S - SmartLED LW L88C, LW L88S LB L89C, LB L89S, LG L890 LS L89K, LO L89K, LY L89K LS L896, LA L896, LO L896, LY L896 - TOPLED LS T670, LO T670, LY T670, LG T670, LP T670 LSG T670, LSP T670, LSY T670, LOP T670, LYG T670 LG T671, LOG T671, LSG T671 LB T673, LV T673, LT T673, LW T673 LH T674 LS T676, LA T676, LO T676, LY T676, LB T676, LH T676, LSB T676, LW T676 LB T67C, LV T67C, LT T67C, LS T67K, LO T67K, LY T67K, LW E67C LS E67B, LA E67B, LO E67B, LY E67B, LB E67C, LV E67C, LT E67C LW T67C LS T679, LY T679, LG T679 LS T770, LO T770, LY T770, LG T770, LP T770 LB T773, LV T773, LT T773, LW T773 LH T774 LS E675, LA E675, LY E675, LS T675 LS T776, LA T776, LO T776, LY T776, LB T776 LHGB T686 LT T68C, LB T68C - Hyper Mini TOPLED® LB M676 - Mini TOPLED Santana® LG M470 LS M47K, LO M47K, LY M47K Source: http://www.osram.convergy.de LUXEON: - LUMILED® LXK2-PW12-R00, LXK2-PW12-S00, LXK2-PW14-U00, LXK2-PW14-V00 LXK2-PM12-R00, LXK2-PM12-S00, LXK2-PM14-U00 LXK2-PE12-Q00, LXK2-PE12-R00, LXK2-PE12-S00, LXK2-PE14-T00, LXK2-PE14-U00 LXK2-PB12-K00, LXK2-PB12-L00, LXK2-PB12-M00, LXK2-PB14-N00, LXK2-PB14-P00, LXK2-PB14-Q00 LXK2-PR12-L00, LXK2-PR12-M00, LXK2-PR14-Q00, LXK2-PR14-R00 LXK2-PD12-Q00, LXK2-PD12-R00, LXK2-PD12-S00 LXK2-PH12-R00, LXK2-PH12-S00 LXK2-PL12-P00, LXK2-PL12-Q00, LXK2-PL12-R00 Source: www.luxeon.com KINGBRIGHT: KA-3528ASYC Source: www.kingbright.com
C1-C21 C30-C36 = rcl_CUSTOM:C-EU: CAPACITOR, European symbol; SPICEPREFIX: C
C28 C29 = corvus_RC:C_0805
D1 D2 D5 D6 = 1N4148WS:1N4148WS-7-F; COPYRIGHT: Copyright (C) 2022 Ultra Librarian. All rights reserved.; MANUFACTURER_PART_NUMBER: 1N4148WS-7-F; MFR_NAME: Diodes Inc
D3 D4 = diode:CGRM400*-G: Molded plasitc,JEDEC SOD-123/Mini SMA Source: Comchip CGRM4001-G.pdf
EGND RX TX = corvus_holes:TH-0.75/0.6
GND_DEBUG SWCLK SWDIO TP1-TP4 TP6 TP7 TP10-TP17 = testpad:TP: Test pad
J1 = 10118193-0001LF:10118193-0001LF: Micro USB B Type Receptacle Check availability <https://pricing.snapeda.com/parts/10118193-0001LF/AMPHENOL%20ICC%20/%20FCI/view-part?ref=eda>; AVAILABILITY: In Stock; DESCRIPTION: Micro USB 2.0, Input Output Connectors, B TYPE RECEPTACLE; MF: AMPHENOL ICC / FCI; MP: 10118193-0001LF; PACKAGE: None; PRICE: None; PURCHASE-URL: https://pricing.snapeda.com/search/part/10118193-0001LF/?ref=eda
J2 = corvus:ADM6-30-01.5-L-4-2-A-TR: 0.635 mm AcceleRate HD High-Density 4-Row Header Check availability <https://pricing.snapeda.com/parts/ADM6-30-01.5-L-4-2-A-TR/Samtec%20Inc./view-part?ref=eda>; AVAILABILITY: In Stock; DESCRIPTION: 120 Position Connector High Density Array, Male Surface Mount Gold; MF: Samtec Inc.; MP: ADM6-30-01.5-L-4-2-A-TR; PACKAGE: None; PRICE: None; PURCHASE-URL: https://pricing.snapeda.com/search/part/ADM6-30-01.5-L-4-2-A-TR/?ref=eda
J3 = corvus:QTH-030-01-L-D-A; COPYRIGHT: Copyright (C) 2023 Ultra Librarian. All rights reserved.; MANUFACTURER_PART_NUMBER: QTH-030-01-L-D-A; MFR_NAME: Samtec Inc
J4 = corvus_parts:USB1125-GF-B; COPYRIGHT: Copyright (C) 2023 Ultra Librarian. All rights reserved.; MANUFACTURER_PART_NUMBER: USB1125-GF-B; MFR_NAME: Global Connector Technology
JMP1 = jump-0r-smd:0R-JUMP: SMD 0R 0805 Jumper
L1 = VLS301HHBX-3r3m:VLS3012HBX-3R3M; COPYRIGHT: Copyright (C) 2022 Ultra Librarian. All rights reserved.; MANUFACTURER_PART_NUMBER: VLS3012HBX-3R3M; MFR_NAME: TDK
L3 = ECS-MPIL0630-3R3MC:ECS-MPIL0630-3R3MC: 10µH Shielded Molded Inductor 5.5A 68mOhm Max Nonstandard Check availability <https://pricing.snapeda.com/parts/ECS-MPIL0630-3R3MC/ECS%20Inc./view-part?ref=eda>; AVAILABILITY: In Stock; DESCRIPTION: 3.3 µH Shielded Molded Inductor 9.5 A 22mOhm Max Nonstandard -; MF: ECS Inc.; MP: ECS-MPIL0630-3R3MC; PACKAGE: Nonstandard ECS Inc.; PRICE: None; PURCHASE-URL: https://pricing.snapeda.com/search/part/ECS-MPIL0630-3R3MC/?ref=eda
R1-R6 R8-R10 R12 R16-R29 R31 = rcl_CUSTOM:R-EU_: RESISTOR, European symbol; SPICEPREFIX: R
R11 = corvus_RC:R_0603; R_NAME: R
U1 = WS25Q16JVUX:W25Q16JVUXIQ; COPYRIGHT: Copyright (C) 2022 Ultra Librarian. All rights reserved.; MANUFACTURER_PART_NUMBER: W25Q16JVUXIQ; MFR_NAME: Winbond
U3 = RP2040:RP2040TR7
U4 = TPS563201DDCR:TPS563201DDCR; COPYRIGHT: Copyright (C) 2022 Ultra Librarian. All rights reserved.; DIGI-KEY_PART_NUMBER_1: 296-47238-1-ND; DIGI-KEY_PART_NUMBER_2: 296-47238-2-ND; DIGI-KEY_PART_NUMBER_3: 296-47238-6-ND; MANUFACTURER_PART_NUMBER: TPS563201DDCR; MFR_NAME: Texas Instruments; REFDES: RefDes; TYPE: TYPE
U7 = 2n7002:2N7002,215; COPYRIGHT: Copyright (C) 2022 Ultra Librarian. All rights reserved.; MANUFACTURER_PART_NUMBER: 2N7002,215; MFR_NAME: Nexperia
U8 = PTS636SK25J:PTS636_SK25J_SMTR_LFS; COPYRIGHT: Copyright (C) 2022 Ultra Librarian. All rights reserved.; MANUFACTURER_PART_NUMBER: PTS636 SK25J SMTR LFS; MFR_NAME: C&K
U10 = TPS54821RHLR:TPS54821RHLR: Check availability <https://pricing.snapeda.com/parts/TPS54821RHLR/Texas%20Instruments/view-part?ref=eda>; AVAILABILITY: In Stock; DESCRIPTION: 4.5-V to 17-V, 8-A synchronous buck converter with hiccup current limit; MF: Texas Instruments; MP: TPS54821RHLR; PACKAGE: VQFN-14 Texas Instruments; PRICE: None; PURCHASE-URL: https://pricing.snapeda.com/search/part/TPS54821RHLR/?ref=eda
U11 U12 = SI2301CDS-T1-GE3:SI2301CDS-T1-GE3; COPYRIGHT: Copyright (C) 2022 Ultra Librarian. All rights reserved.; DIGI-KEY_PART_NUMBER_1: SI2301CDS-T1-GE3CT-ND; DIGI-KEY_PART_NUMBER_2: SI2301CDS-T1-GE3DKR-ND; DIGI-KEY_PART_NUMBER_3: SI2301CDS-T1-GE3TR-ND; MANUFACTURER_PART_NUMBER: SI2301CDS-T1-GE3; MFR_NAME: Vishay
U$5 = corvus_parts:WIFI-RTL8822BU
U$6 U$7 = corvus_parts:EVQ-P7J01P
X1 = corvus_parts:FH12-30S-0.5S: 0.5mm Pitch Connectors For FPC/FFC Source: Data sheet <http://www.hirose.co.jp/cataloge_hp/e58605370.pdf>; MPN: FH12-30S-0.5SH(55); OC_FARNELL: 1324555; OC_NEWARK: 34M6176
XTAL1 = MCSJK-7UCrystal:MCSJK-7U-12.00-10-10-80-B-10; COPYRIGHT: Copyright (C) 2022 Ultra Librarian. All rights reserved.; MANUFACTURER_PART_NUMBER: MCSJK-7U-12.00-10-10-80-B-10; MFR_NAME: Multicomp